# Altium schematic sheet Sheet1.SchDoc
size A4; SheetNumber: 1; SheetTotal: 1
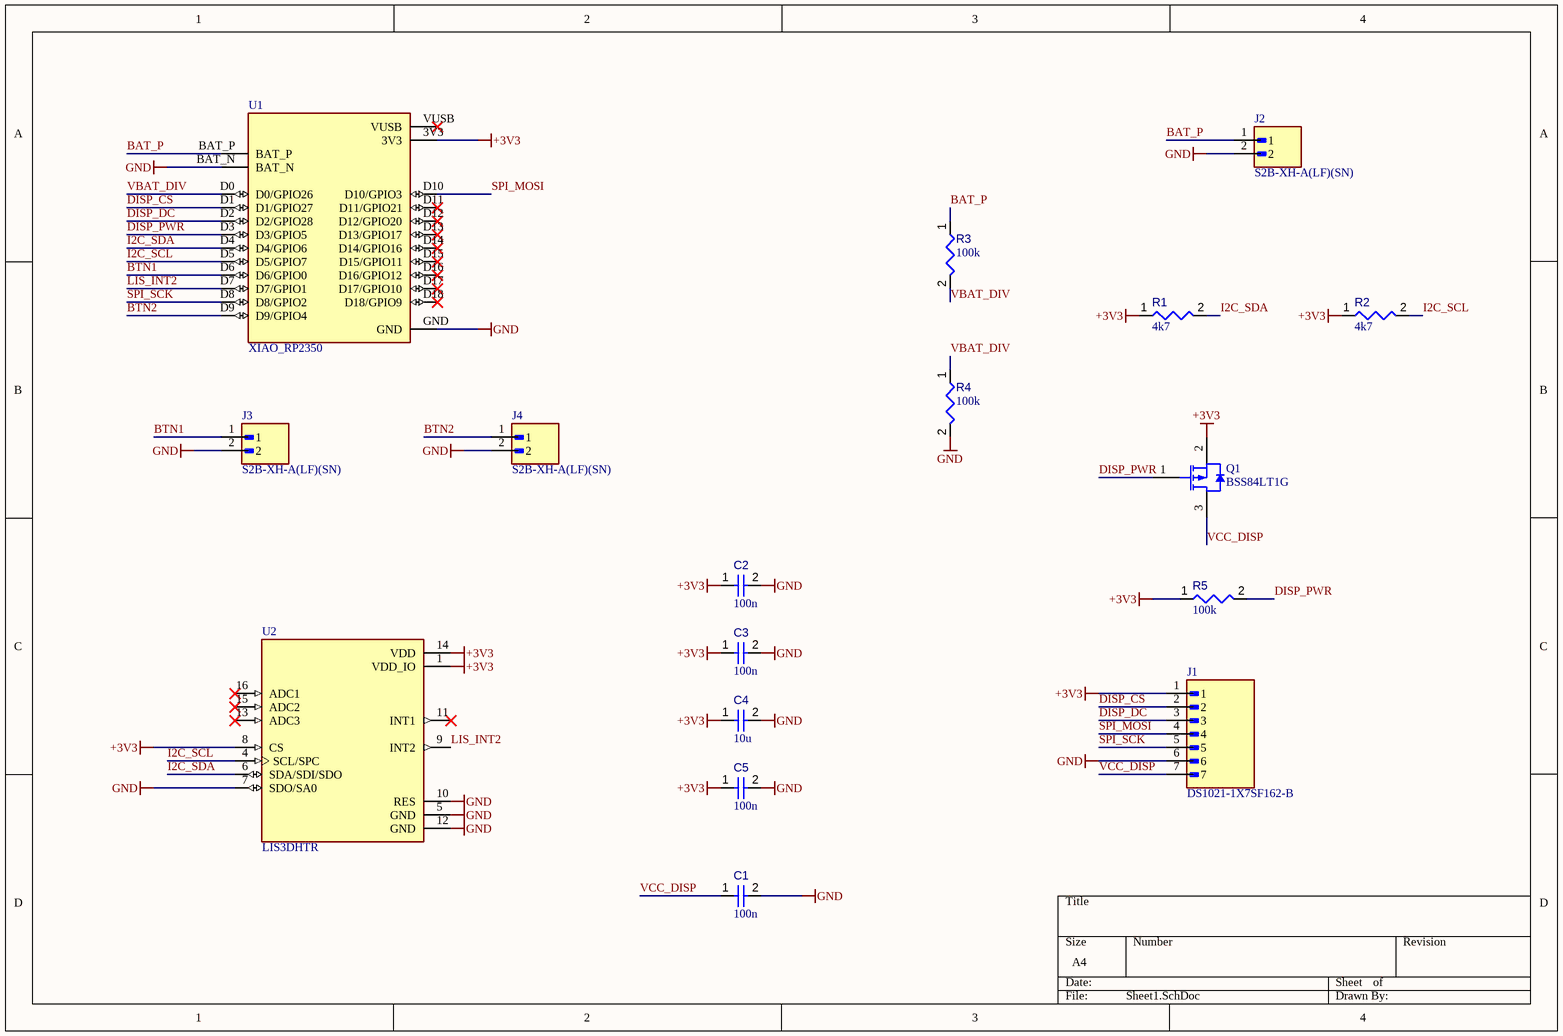
[diagram p0: Sheet1.SchDoc]

## Parts
C1  value 100n  [CAPC0402(1005)60_L]  (hidden comment: Capacitor 470pF +/-20% 50V 0402)
C2  value 100n  [CAPC0402(1005)60_L]  (hidden comment: Capacitor 470pF +/-20% 50V 0402)
C3  value 100n  [CAPC0402(1005)60_L]  (hidden comment: Capacitor 470pF +/-20% 50V 0402)
C4  value 10u  [CAPC0402(1005)60_L]  (hidden comment: Capacitor 470pF +/-20% 50V 0402)
C5  value 100n  [CAPC0402(1005)60_L]  (hidden comment: Capacitor 470pF +/-20% 50V 0402)
J1  DS1021-1X7SF162-B  [CONNFLY_DS1021-1X7SF162-B]
J2  S2B-XH-A(LF)(SN)  [JST_S2B-PH-K-S(LF)(SN)]
J3  S2B-XH-A(LF)(SN)  [JST_S2B-PH-K-S(LF)(SN)]
J4  S2B-XH-A(LF)(SN)  [JST_S2B-PH-K-S(LF)(SN)]
Q1  BSS84LT1G  [ONSC-SOT-23-3-318-08_V]
R1  value 4k7  [RESC0402(1005)_L]  (hidden comment: Resistor 953K +/-1 % 0402 63 mW)
R2  value 4k7  [RESC0402(1005)_L]  (hidden comment: Resistor 953K +/-1 % 0402 63 mW)
R3  value 100k  [RESC0402(1005)_L]  (hidden comment: Resistor 953K +/-1 % 0402 63 mW)
R4  value 100k  [RESC0402(1005)_L]  (hidden comment: Resistor 953K +/-1 % 0402 63 mW)
R5  value 100k  [RESC0402(1005)_L]  (hidden comment: Resistor 953K +/-1 % 0402 63 mW)
U1  XIAO_RP2350  [MODULE_XIAO_RP2350]
U2  LIS3DHTR  [XDCR_LIS3DHTR]

## Nets
+3V3: C2.1 C3.1 C4.1 C5.1 J1.1 Q1.2(SOURCE) R1.1 R2.1 R5.1 U1.3V3 U2.1(VDD_IO) U2.8(CS) U2.14(VDD)
GND: C1.2 C2.2 C3.2 C4.2 C5.2 J1.6 J2.2 J3.2 J4.2 R4.2 U1.BAT_N U1.GND U2.5(GND) U2.7(SDO/SA0) U2.10(RES) U2.12(GND)
BAT_P: J2.1 R3.1 U1.BAT_P
BTN1: J3.1 U1.D6(D6/GPIO0)
BTN2: J4.1 U1.D9(D9/GPIO4)
DISP_CS: J1.2 U1.D1(D1/GPIO27)
DISP_DC: J1.3 U1.D2(D2/GPIO28)
DISP_PWR: Q1.1(GATE) R5.2 U1.D3(D3/GPIO5)
I2C_SCL: R2.2 U1.D5(D5/GPIO7) U2.4(SCL/SPC)
I2C_SDA: R1.2 U1.D4(D4/GPIO6) U2.6(SDA/SDI/SDO)
LIS_INT2: U1.D7(D7/GPIO1) U2.9(INT2)
SPI_MOSI: J1.4 U1.D10(D10/GPIO3)
SPI_SCK: J1.5 U1.D8(D8/GPIO2)
VBAT_DIV: R3.2 R4.1 U1.D0(D0/GPIO26)
VCC_DISP: C1.1 J1.7 Q1.3(DRAIN)

Not connected (* = marked no-connect by the designer): U1 D11(D11/GPIO21)* D12(D12/GPIO20)* D13(D13/GPIO17)* D14(D14/GPIO16)* D15(D15/GPIO11)* D16(D16/GPIO12)* D17(D17/GPIO10)* D18(D18/GPIO9)* VUSB*; U2 11(INT1)* 13(ADC3)* 15(ADC2)* 16(ADC1)*

## Library data of the parts
C1-C5 = CMP-001-00068-4: Chip Capacitor, 470pF +/-20%, 50V, 0402, Thickness 0.6 mm; Tolerance: 20%; Mounting Technology: SMT; Max Operating Temperature: 85°C; Min Operating Temperature: -55°C; Pins: 2; Voltage Rating: 50V; Case/Package: 0402
J1 = DS1021-1X7SF162-B: Pin header; pin strips; male; PIN: 7; straight; 2.54mm; THT; 1x7; MF: Connfly; SnapEDA_Link: https://www.snapeda.com/parts/DS1021-1X7SF162-B/Connfly/view-part/?ref=snap; Package: None; Value: *; MP: DS1021-1X7SF162-B; Check_prices: https://www.snapeda.com/parts/DS1021-1X7SF162-B/Connfly/view-part/?ref=eda
J2-J4 = S2B-PH-K-S(LF)(SN): Connector Header Through Hole, Right Angle 2 position; MF: JST Sales America Inc.; SnapEDA_Link: https://www.snapeda.com/parts/S2B-PH-K-S(LF)(SN)/JST/view-part/?ref=snap; Package: NON STANDARD-2 J.S.T.; Value: *; MP: S2B-PH-K-S(LF)(SN); Check_prices: https://www.snapeda.com/parts/S2B-PH-K-S(LF)(SN)/JST/view-part/?ref=eda
Q1 = CMP-013-00012-4: Power MOSFET Single P-Channel, -50 V, 10 Ohm, 3-Pin SOT-23, Pb-Free, Tape and Reel; Manufacturer: ON Semiconductor; Elements: 1; Power: 225mW; Nominal Vgs: -10V; Nominal Dual Supply Voltage: 5V; Typical Rise Time: 1ns; Input Capacitance: 30pF; Rds On Max: 10Ohm; RoHS Compliant: True; Mounting Technology: SM; Package Quantity: 3000; Min Operating Temperature: -55°C; Case/Package: SOT-23-3; Packaging: TapeandReel; Package Description: 3-Pin Small Outline Transistor, Body 2.9 x 1.3 mm, Pitch 0.95 mm; Datasheet Version: Rev. 9, 10/2016; Pins: 3; Datasheet URL: http://www.onsemi.com/pub_link/Collateral/BSS84LT1-D.PDF; Max Operating Temperature: 150°C; Package Reference: SOT-23 (318-08)
R1-R5 = CMP-009-00125-3: Chip Resistor, 953 kOhms, +/-1 %, 63 mW, -55 to 155 degC, 0402; Tolerance: 1%; Power: 63mW; Case/Package: 0402; Min Operating Temperature: -55°C; Pins: 2; Max Operating Temperature: 155°C
U1 = XIAO_RP2350: RP2350 Seeeduino XIAO - ARM Cortex-M33 MCU 32-Bit Embedded Evaluation Board; MF: Seeed Studio; MP: XIAO RP2350; SnapEDA_Link: https://www.snapeda.com/parts/XIAO%20RP2350/Seeed+Studio/view-part/?ref=snap; Package: None; Value: *; Check_prices: https://www.snapeda.com/parts/XIAO%20RP2350/Seeed+Studio/view-part/?ref=eda
U2 = LIS3DHTR: Accelerometer X, Y, Z Axis Â±2g, 4g, 8g, 16g 0.5Hz ~ 625Hz 16-LGA (3x3); MF: STMicroelectronics; Value: *; Package: LGA-16 STMicroelectronics; Check_prices: https://www.snapeda.com/parts/LIS3DHTR/STMicroelectronics/view-part/278195/?ref=eda; MP: LIS3DHTR; SnapEDA_Link: https://www.snapeda.com/parts/LIS3DHTR/STMicroelectronics/view-part/278195/?ref=snap; Digi-Key_Part_Number: 497-10613-1-ND